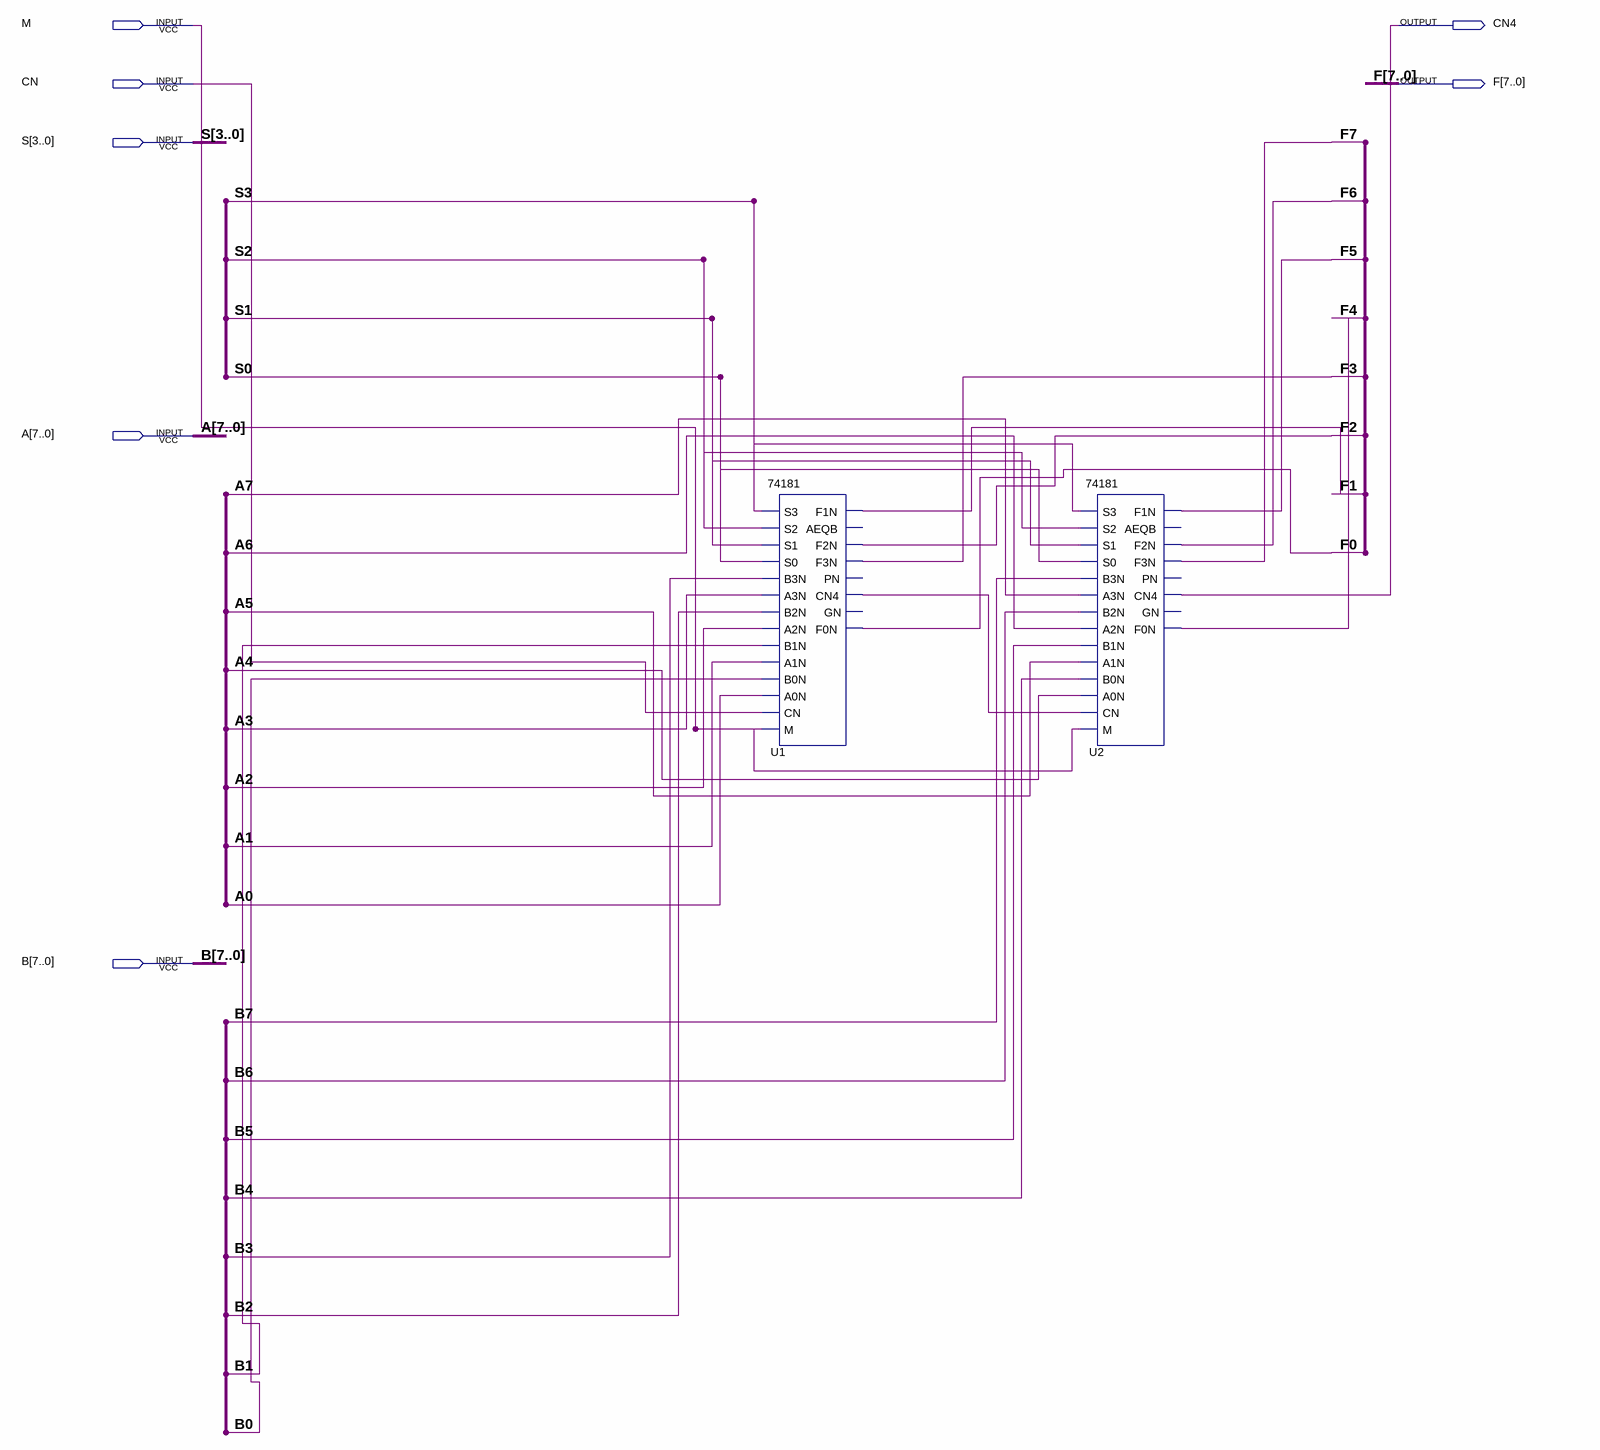
[diagram p0: schematic sheet]
// Quartus schematic alu8.bdf as structural Verilog: 2 symbols, 7 pins
module alu8 (
  input  M,
  input  CN,
  input  [3:0] S,
  input  [7:0] A,
  input  [7:0] B,
  output CN4,
  output [7:0] F
);

  wire U1_cn4;

  \74181  U1 (
    .S3(S[3]), .S2(S[2]), .S1(S[1]), .S0(S[0]), .B3N(B[3]), .A3N(A[3]), .B2N(B[2]), .A2N(A[2]), .B1N(B[1]),
    .A1N(A[1]), .B0N(B[0]), .A0N(A[0]), .CN(CN), .M(M), .F1N(F[1]), .F2N(F[2]), .F3N(F[3]), .CN4(U1_cn4),
    .F0N(F[0]));  // open: AEQB, PN, GN
  \74181  U2 (
    .S3(S[3]), .S2(S[2]), .S1(S[1]), .S0(S[0]), .B3N(B[7]), .A3N(A[7]), .B2N(B[6]), .A2N(A[6]), .B1N(B[5]),
    .A1N(A[5]), .B0N(B[4]), .A0N(A[4]), .CN(U1_cn4), .M(M), .F1N(F[5]), .F2N(F[6]), .F3N(F[7]), .CN4(CN4),
    .F0N(F[4]));  // open: AEQB, PN, GN
endmodule
